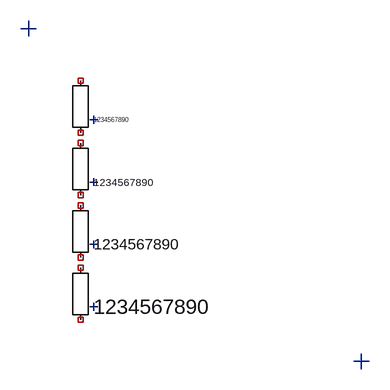
[diagram p0: schematic sizes_0_to_3.asc]
sizes_0_to_3.asc, the LTspice schematic file:
Version 4
SHEET 1 2400 1600
WIRE -76 -64 -52 -64
WIRE -64 -76 -64 -52
WIRE 436 448 460 448
WIRE 448 436 448 460
WIRE 30 76 42 76
WIRE 36 70 36 82
SYMBOL res 0 0 R0
WINDOW 0 0 0 Invisible 2
WINDOW 3 36 76 Left 0
SYMATTR InstName R1
SYMATTR Value 1234567890
WIRE 30 172 42 172
WIRE 36 166 36 178
SYMBOL res 0 96 R0
WINDOW 0 0 0 Invisible 2
WINDOW 3 36 76 Left 1
SYMATTR InstName R2
SYMATTR Value 1234567890
WIRE 30 268 42 268
WIRE 36 262 36 274
SYMBOL res 0 192 R0
WINDOW 0 0 0 Invisible 2
WINDOW 3 36 76 Left 2
SYMATTR InstName R3
SYMATTR Value 1234567890
WIRE 30 364 42 364
WIRE 36 358 36 370
SYMBOL res 0 288 R0
WINDOW 0 0 0 Invisible 2
WINDOW 3 36 76 Left 3
SYMATTR InstName R4
SYMATTR Value 1234567890

The netlist it stands for:
* sizes_0_to_3.asc
R1 NC_01 NC_02 1234567890
R2 NC_03 NC_04 1234567890
R3 NC_05 NC_06 1234567890
R4 NC_07 NC_08 1234567890
.backanno
.end